# Altium project Main_Board.PrjPcb (part 2 of 44)

## Sheet Ultrascale+_01.SchDoc: Ultrascale+_01
size A3; Organization: Altium Limited; Address1: L3, 12a Rodborough Rd; Address2: Frenchs Forest; Address3: NSW; Address4: Australia 2086
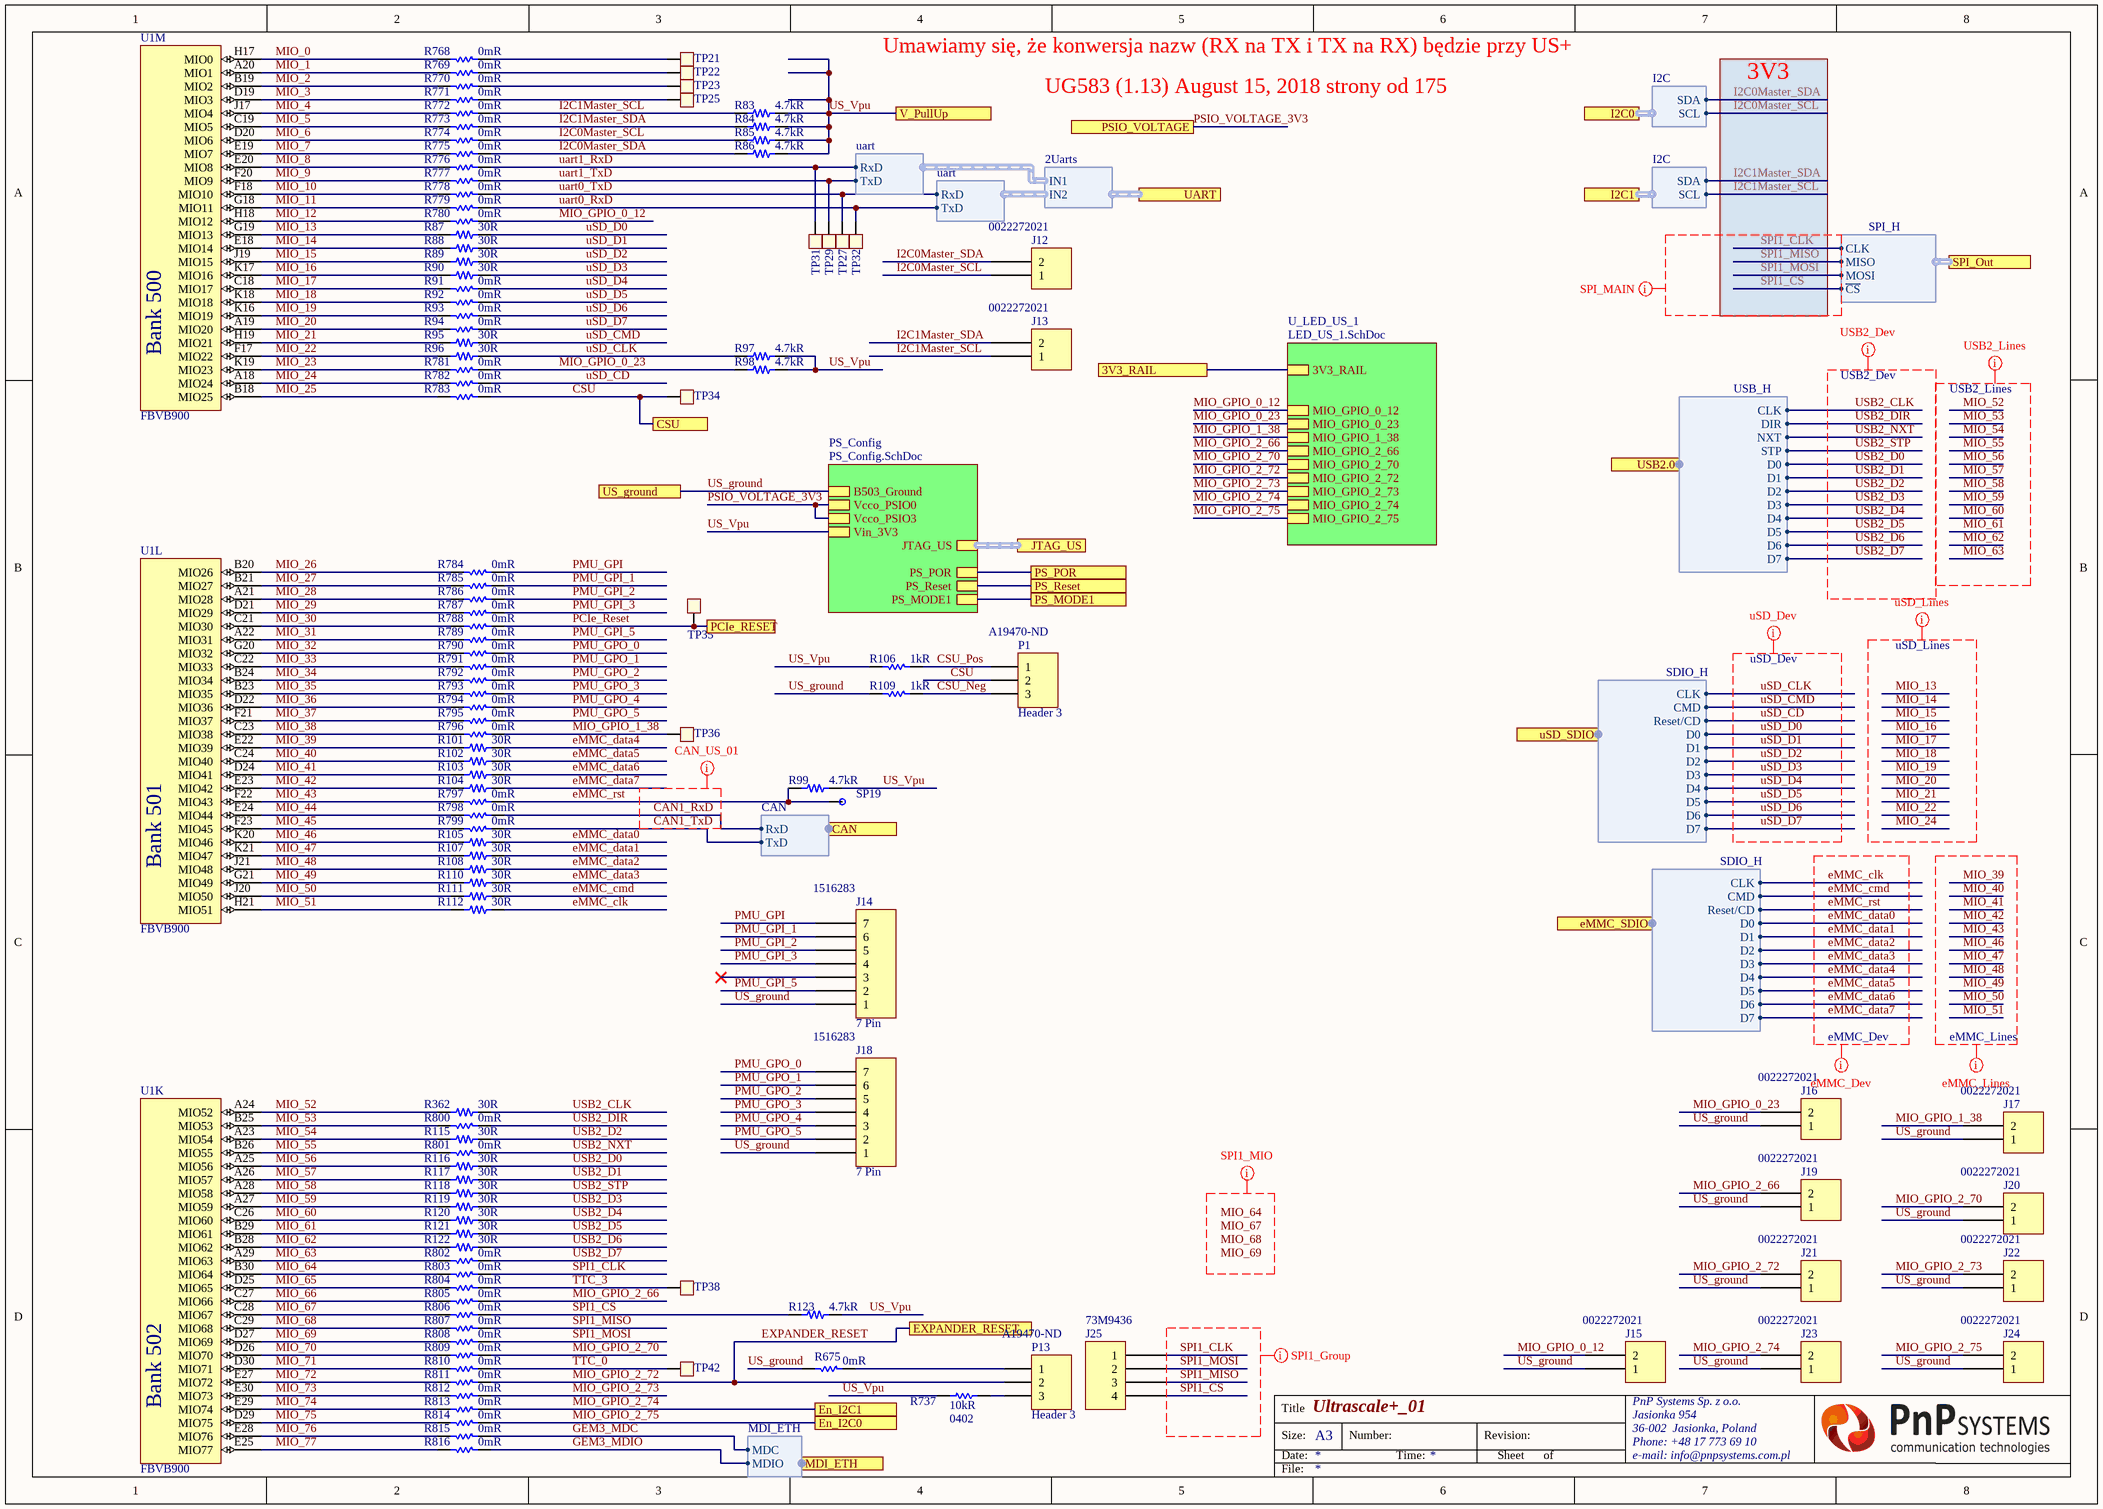
[diagram p1: Ultrascale+_01.SchDoc]

### Parts
J12  Supplier Part Number 1: 0022272021  [MOLEX KK 0022272021]  (hidden comment: MOLEX - 22-27-2021 - WIRE-BOARD CONNECTOR HEADER 2 POSITION, 2.54MM)
J13  Supplier Part Number 1: 0022272021  [MOLEX KK 0022272021]  (hidden comment: MOLEX - 22-27-2021 - WIRE-BOARD CONNECTOR HEADER 2 POSITION, 2.54MM)
J14  7 Pin  Supplier Part Number 1: 1516283  [JST XH B7B-XH-A]
J15  Supplier Part Number 1: 0022272021  [MOLEX KK 0022272021]  (hidden comment: MOLEX - 22-27-2021 - WIRE-BOARD CONNECTOR HEADER 2 POSITION, 2.54MM)
J16  Supplier Part Number 1: 0022272021  [MOLEX KK 0022272021]  (hidden comment: MOLEX - 22-27-2021 - WIRE-BOARD CONNECTOR HEADER 2 POSITION, 2.54MM)
J17  Supplier Part Number 1: 0022272021  [MOLEX KK 0022272021]  (hidden comment: MOLEX - 22-27-2021 - WIRE-BOARD CONNECTOR HEADER 2 POSITION, 2.54MM)
J18  7 Pin  Supplier Part Number 1: 1516283  [JST XH B7B-XH-A]
J19  Supplier Part Number 1: 0022272021  [MOLEX KK 0022272021]  (hidden comment: MOLEX - 22-27-2021 - WIRE-BOARD CONNECTOR HEADER 2 POSITION, 2.54MM)
J20  Supplier Part Number 1: 0022272021  [MOLEX KK 0022272021]  (hidden comment: MOLEX - 22-27-2021 - WIRE-BOARD CONNECTOR HEADER 2 POSITION, 2.54MM)
J21  Supplier Part Number 1: 0022272021  [MOLEX KK 0022272021]  (hidden comment: MOLEX - 22-27-2021 - WIRE-BOARD CONNECTOR HEADER 2 POSITION, 2.54MM)
J22  Supplier Part Number 1: 0022272021  [MOLEX KK 0022272021]  (hidden comment: MOLEX - 22-27-2021 - WIRE-BOARD CONNECTOR HEADER 2 POSITION, 2.54MM)
J23  Supplier Part Number 1: 0022272021  [MOLEX KK 0022272021]  (hidden comment: MOLEX - 22-27-2021 - WIRE-BOARD CONNECTOR HEADER 2 POSITION, 2.54MM)
J24  Supplier Part Number 1: 0022272021  [MOLEX KK 0022272021]  (hidden comment: MOLEX - 22-27-2021 - WIRE-BOARD CONNECTOR HEADER 2 POSITION, 2.54MM)
J25  Supplier Part Number 1: 73M9436  [JST XH B4B-XH-A]  (hidden comment: JST (JAPAN SOLDERLESS TERMINALS) - B4B-XH-A (LF)(SN) - Wire-To-Board-Steckverbinder, vertikal, 2.5 mm, 4 Kontakt(e), Stiftleiste, Baureihe XH)
P1  Header 3  Supplier Part Number 1: A19470-ND  [HDR1X3]
P13  Header 3  Supplier Part Number 1: A19470-ND  [HDR1X3]
R83  4.7kR  [RES 0402/1005 RF KK]
R84  4.7kR  [RES 0402/1005 RF KK]
R85  4.7kR  [RES 0402/1005 RF KK]
R86  4.7kR  [RES 0402/1005 RF KK]
R87  30R  [RES 0402/1005 RF KK]
R88  30R  [RES 0402/1005 RF KK]
R89  30R  [RES 0402/1005 RF KK]
R90  30R  [RES 0402/1005 RF KK]
R91  0mR  [RES 0402/1005 RF KK]
R92  0mR  [RES 0402/1005 RF KK]
R93  0mR  [RES 0402/1005 RF KK]
R94  0mR  [RES 0402/1005 RF KK]
R95  30R  [RES 0402/1005 RF KK]
R96  30R  [RES 0402/1005 RF KK]
R97  4.7kR  [RES 0402/1005 RF KK]
R98  4.7kR  [RES 0402/1005 RF KK]
R99  4.7kR  [RES 0402/1005 RF KK]
R101  30R  [RES 0402/1005 RF KK]
R102  30R  [RES 0402/1005 RF KK]
R103  30R  [RES 0402/1005 RF KK]
R104  30R  [RES 0402/1005 RF KK]
R105  30R  [RES 0402/1005 RF KK]
R106  1kR  [RES 0402/1005 RF KK]
R107  30R  [RES 0402/1005 RF KK]
R108  30R  [RES 0402/1005 RF KK]
R109  1kR  [RES 0402/1005 RF KK]
R110  30R  [RES 0402/1005 RF KK]
R111  30R  [RES 0402/1005 RF KK]
R112  30R  [RES 0402/1005 RF KK]
R115  30R  [RES 0402/1005 RF KK]
R116  30R  [RES 0402/1005 RF KK]
R117  30R  [RES 0402/1005 RF KK]
R118  30R  [RES 0402/1005 RF KK]
R119  30R  [RES 0402/1005 RF KK]
R120  30R  [RES 0402/1005 RF KK]
R121  30R  [RES 0402/1005 RF KK]
R122  30R  [RES 0402/1005 RF KK]
R123  4.7kR  [RES 0402/1005 RF KK]
R362  30R  [RES 0402/1005 RF KK]
R675  0mR  [RES 0402/1005 RF KK]
R737  10kR  Case Code (Imperial): 0402  [RES 0402/1005 RF KK]
R768  0mR  [RES 0402/1005 RF KK]
R769  0mR  [RES 0402/1005 RF KK]
R770  0mR  [RES 0402/1005 RF KK]
R771  0mR  [RES 0402/1005 RF KK]
R772  0mR  [RES 0402/1005 RF KK]
R773  0mR  [RES 0402/1005 RF KK]
R774  0mR  [RES 0402/1005 RF KK]
R775  0mR  [RES 0402/1005 RF KK]
R776  0mR  [RES 0402/1005 RF KK]
R777  0mR  [RES 0402/1005 RF KK]
R778  0mR  [RES 0402/1005 RF KK]
R779  0mR  [RES 0402/1005 RF KK]
R780  0mR  [RES 0402/1005 RF KK]
R781  0mR  [RES 0402/1005 RF KK]
R782  0mR  [RES 0402/1005 RF KK]
R783  0mR  [RES 0402/1005 RF KK]
R784  0mR  [RES 0402/1005 RF KK]
R785  0mR  [RES 0402/1005 RF KK]
R786  0mR  [RES 0402/1005 RF KK]
R787  0mR  [RES 0402/1005 RF KK]
R788  0mR  [RES 0402/1005 RF KK]
R789  0mR  [RES 0402/1005 RF KK]
R790  0mR  [RES 0402/1005 RF KK]
R791  0mR  [RES 0402/1005 RF KK]
R792  0mR  [RES 0402/1005 RF KK]
R793  0mR  [RES 0402/1005 RF KK]
R794  0mR  [RES 0402/1005 RF KK]
R795  0mR  [RES 0402/1005 RF KK]
R796  0mR  [RES 0402/1005 RF KK]
R797  0mR  [RES 0402/1005 RF KK]
R798  0mR  [RES 0402/1005 RF KK]
R799  0mR  [RES 0402/1005 RF KK]
R800  0mR  [RES 0402/1005 RF KK]
R801  0mR  [RES 0402/1005 RF KK]
R802  0mR  [RES 0402/1005 RF KK]
R803  0mR  [RES 0402/1005 RF KK]
R804  0mR  [RES 0402/1005 RF KK]
R805  0mR  [RES 0402/1005 RF KK]
R806  0mR  [RES 0402/1005 RF KK]
R807  0mR  [RES 0402/1005 RF KK]
R808  0mR  [RES 0402/1005 RF KK]
R809  0mR  [RES 0402/1005 RF KK]
R810  0mR  [RES 0402/1005 RF KK]
R811  0mR  [RES 0402/1005 RF KK]
R812  0mR  [RES 0402/1005 RF KK]
R813  0mR  [RES 0402/1005 RF KK]
R814  0mR  [RES 0402/1005 RF KK]
R815  0mR  [RES 0402/1005 RF KK]
R816  0mR  [RES 0402/1005 RF KK]
SP19  SP  [MeasureTP]  (value not drawn)
TP21  TestPoint  [TestPoint]  (value not drawn)
TP22  TestPoint  [TestPoint]  (value not drawn)
TP23  TestPoint  [TestPoint]  (value not drawn)
TP25  TestPoint  [TestPoint]  (value not drawn)
TP27  TestPoint  [TestPoint]  (value not drawn)
TP29  TestPoint  [TestPoint]  (value not drawn)
TP31  TestPoint  [TestPoint]  (value not drawn)
TP32  TestPoint  [TestPoint]  (value not drawn)
TP34  TestPoint  [TestPoint]  (value not drawn)
TP35  TestPoint  [TestPoint]  (value not drawn)
TP36  TestPoint  [TestPoint]  (value not drawn)
TP38  TestPoint  [TestPoint]  (value not drawn)
TP42  TestPoint  [TestPoint]  (value not drawn)
U1  FBVB900  [FBVB900 XX]  (parts K,L,M of 23)

### Sub-sheets
PS_Config = PS_Config.SchDoc: JTAG_US (harness JTAG), B503_Ground, Vcco_PSIO0, Vcco_PSIO3, Vin_3V3, PS_POR, PS_Reset, PS_MODE1
U_LED_US_1 = LED_US_1.SchDoc: 3V3_RAIL, MIO_GPIO_0_12, MIO_GPIO_0_23, MIO_GPIO_1_38, MIO_GPIO_2_66, MIO_GPIO_2_70, MIO_GPIO_2_72, MIO_GPIO_2_73, MIO_GPIO_2_74, MIO_GPIO_2_75

### Ports
3V3_RAIL, CAN (harness CAN), CSU, eMMC_SDIO (harness SDIO_H), En_I2C0, En_I2C1, EXPANDER_RESET, I2C0 (harness I2C), I2C1 (harness I2C), JTAG_US (harness JTAG), MDI_ETH (harness MDI_ETH), PCIe_RESET, PS_MODE1, PS_POR, PS_Reset, PSIO_VOLTAGE, SPI_Out (harness SPI_H), UART (harness 2Uarts), US_ground, USB2.0 (harness USB_H), uSD_SDIO (harness SDIO_H), V_PullUp

### Harnesses
I2C: SDA, SCL
SPI_H: CLK, MISO, MOSI, ~{CS}
SDIO_H: CLK, CMD, Reset/CD, D0, D1, D2, D3, D4, D5, D6, D7
uart: RxD, TxD
USB_H: CLK, DIR, NXT, STP, D0, D1, D2, D3, D4, D5, D6, D7
CAN: RxD, TxD
MDI_ETH: MDC, MDIO
2Uarts: IN2, IN1

### Nets
US_ground: J14.1 J15.1 J16.1 J17.1 J18.1 J19.1 J20.1 J21.1 J22.1 J23.1 J24.1 R109.1 R675.1 ; port US_ground, sheet PS_Config/B503_Ground  [project net B503_Ground]
3V3_RAIL: port 3V3_RAIL, sheet U_LED_US_1/3V3_RAIL
CAN1_RxD: R798.1 ; port CAN.RxD
CAN1_TxD: R799.1 ; port CAN.TxD
CSU: P1.2 R783.1 TP34.1 ; port CSU
CSU_Neg: P1.3 R109.2
CSU_Pos: P1.1 R106.2
eMMC_clk: R112.2 ; port eMMC_SDIO.CLK
eMMC_cmd: R111.2 ; port eMMC_SDIO.CMD
eMMC_data0: R105.2 ; port eMMC_SDIO.D0
eMMC_data1: R107.2 ; port eMMC_SDIO.D1
eMMC_data2: R108.2 ; port eMMC_SDIO.D2
eMMC_data3: R110.2 ; port eMMC_SDIO.D3
eMMC_data4: R101.2 ; port eMMC_SDIO.D4
eMMC_data5: R102.2 ; port eMMC_SDIO.D5
eMMC_data6: R103.2 ; port eMMC_SDIO.D6
eMMC_data7: R104.2 ; port eMMC_SDIO.D7
eMMC_rst: R99.1 R797.1 SP19.1 ; port eMMC_SDIO.Reset/CD
EXPANDER_RESET: J21.2 P13.2 R811.1 ; port EXPANDER_RESET, sheet U_LED_US_1/MIO_GPIO_2_72  [also labelled MIO_GPIO_2_72]
GEM3_MDC: R815.1 ; port MDI_ETH.MDC
GEM3_MDIO: R816.1 ; port MDI_ETH.MDIO
I2C0Master_SCL: J12.1 R85.1 R774.1 ; port I2C0.SCL  [project net I2C0_PS.SCL]
I2C0Master_SDA: J12.2 R86.1 R775.1 ; port I2C0.SDA  [project net I2C0_PS.SDA]
I2C1Master_SCL: J13.1 R83.1 R772.1 ; port I2C1.SCL  [project net I2C1_PS.SCL]
I2C1Master_SDA: J13.2 R84.1 R773.1 ; port I2C1.SDA  [project net I2C1_PS.SDA]
MIO_0: R768.2 U1.H17(MIO0)
MIO_1: R769.2 U1.A20(MIO1)
MIO_2: R770.2 U1.B19(MIO2)
MIO_3: R771.2 U1.D19(MIO3)
MIO_4: R772.2 U1.J17(MIO4)
MIO_5: R773.2 U1.C19(MIO5)
MIO_6: R774.2 U1.D20(MIO6)
MIO_7: R775.2 U1.E19(MIO7)
MIO_8: R776.2 U1.E20(MIO8)
MIO_9: R777.2 U1.F20(MIO9)
MIO_10: R778.2 U1.F18(MIO10)
MIO_11: R779.2 U1.G18(MIO11)
MIO_12: R780.2 U1.H18(MIO12)
MIO_13: R87.1 U1.G19(MIO13)
MIO_14: R88.1 U1.E18(MIO14)
MIO_15: R89.1 U1.J19(MIO15)
MIO_16: R90.1 U1.K17(MIO16)
MIO_17: R91.2 U1.C18(MIO17)
MIO_18: R92.2 U1.K18(MIO18)
MIO_19: R93.2 U1.K16(MIO19)
MIO_20: R94.2 U1.A19(MIO20)
MIO_21: R95.1 U1.H19(MIO21)
MIO_22: R96.1 U1.F17(MIO22)
MIO_23: R781.2 U1.K19(MIO23)
MIO_24: R782.2 U1.A18(MIO24)
MIO_25: R783.2 U1.B18(MIO25)
MIO_26: R784.2 U1.B20(MIO26)
MIO_27: R785.2 U1.B21(MIO27)
MIO_28: R786.2 U1.A21(MIO28)
MIO_29: R787.2 U1.D21(MIO29)
MIO_30: R788.2 U1.C21(MIO30)
MIO_31: R789.2 U1.A22(MIO31)
MIO_32: R790.2 U1.G20(MIO32)
MIO_33: R791.2 U1.C22(MIO33)
MIO_34: R792.2 U1.B24(MIO34)
MIO_35: R793.2 U1.B23(MIO35)
MIO_36: R794.2 U1.D22(MIO36)
MIO_37: R795.2 U1.F21(MIO37)
MIO_38: R796.2 U1.C23(MIO38)
MIO_39: R101.1 U1.E22(MIO39)
MIO_40: R102.1 U1.C24(MIO40)
MIO_41: R103.1 U1.D24(MIO41)
MIO_42: R104.1 U1.E23(MIO42)
MIO_43: R797.2 U1.F22(MIO43)
MIO_44: R798.2 U1.E24(MIO44)
MIO_45: R799.2 U1.F23(MIO45)
MIO_46: R105.1 U1.K20(MIO46)
MIO_47: R107.1 U1.K21(MIO47)
MIO_48: R108.1 U1.J21(MIO48)
MIO_49: R110.1 U1.G21(MIO49)
MIO_50: R111.1 U1.J20(MIO50)
MIO_51: R112.1 U1.H21(MIO51)
MIO_52: R362.1 U1.A24(MIO52)
MIO_53: R800.2 U1.B25(MIO53)
MIO_54: R115.1 U1.A23(MIO54)
MIO_55: R801.2 U1.B26(MIO55)
MIO_56: R116.1 U1.A25(MIO56)
MIO_57: R117.1 U1.A26(MIO57)
MIO_58: R118.1 U1.A28(MIO58)
MIO_59: R119.1 U1.A27(MIO59)
MIO_60: R120.1 U1.C26(MIO60)
MIO_61: R121.1 U1.B29(MIO61)
MIO_62: R122.1 U1.B28(MIO62)
MIO_63: R802.2 U1.A29(MIO63)
MIO_64: R803.2 U1.B30(MIO64)
MIO_65: R804.2 U1.D25(MIO65)
MIO_66: R805.2 U1.C27(MIO66)
MIO_67: R806.2 U1.C28(MIO67)
MIO_68: R807.2 U1.C29(MIO68)
MIO_69: R808.2 U1.D27(MIO69)
MIO_70: R809.2 U1.D26(MIO70)
MIO_71: R810.2 U1.D30(MIO71)
MIO_72: R811.2 U1.E27(MIO72)
MIO_73: R812.2 U1.E30(MIO73)
MIO_74: R813.2 U1.E29(MIO74)
MIO_75: R814.2 U1.D29(MIO75)
MIO_76: R815.2 U1.E28(MIO76)
MIO_77: R816.2 U1.E25(MIO77)
MIO_GPIO_0_12: J15.2 R780.1 ; sheet U_LED_US_1/MIO_GPIO_0_12
MIO_GPIO_0_23: J16.2 R98.1 R781.1 ; sheet U_LED_US_1/MIO_GPIO_0_23
MIO_GPIO_1_38: J17.2 R796.1 TP36.1 ; sheet U_LED_US_1/MIO_GPIO_1_38
MIO_GPIO_2_66: J19.2 R805.1 ; sheet U_LED_US_1/MIO_GPIO_2_66
MIO_GPIO_2_70: J20.2 R809.1 ; sheet U_LED_US_1/MIO_GPIO_2_70
MIO_GPIO_2_73: J22.2 R812.1 ; sheet U_LED_US_1/MIO_GPIO_2_73
MIO_GPIO_2_74: J23.2 R813.1 ; port En_I2C1, sheet U_LED_US_1/MIO_GPIO_2_74
MIO_GPIO_2_75: J24.2 R814.1 ; port En_I2C0, sheet U_LED_US_1/MIO_GPIO_2_75
PCIe_RESET: R788.1 TP35.1 ; port PCIe_RESET
PMU_GPI: J14.7 R784.1
PMU_GPI_1: J14.6 R785.1
PMU_GPI_2: J14.5 R786.1
PMU_GPI_3: J14.4 R787.1
PMU_GPI_5: J14.2 R789.1
PMU_GPO_0: J18.7 R790.1
PMU_GPO_1: J18.6 R791.1
PMU_GPO_2: J18.5 R792.1
PMU_GPO_3: J18.4 R793.1
PMU_GPO_4: J18.3 R794.1
PMU_GPO_5: J18.2 R795.1
PS_MODE1: port PS_MODE1, sheet PS_Config/PS_MODE1
PS_POR: port PS_POR, sheet PS_Config/PS_POR
PS_Reset: port PS_Reset, sheet PS_Config/PS_Reset
PSIO_VOLTAGE_3V3: R83.2 R84.2 R85.2 R86.2 R97.2 R98.2 R99.2 R106.1 R123.2 R737.2 ; port V_PullUp, port PSIO_VOLTAGE, sheet PS_Config/Vcco_PSIO0, sheet PS_Config/Vcco_PSIO3, sheet PS_Config/Vin_3V3  [also labelled US_Vpu]  [project net ETH_VDDIO]
SPI1_CLK: J25.1 R803.1 ; port SPI_Out.CLK
SPI1_CS: J25.4 R123.1 R806.1 ; port SPI_Out.~{CS}
SPI1_MISO: J25.3 R807.1 ; port SPI_Out.MISO
SPI1_MOSI: J25.2 R808.1 ; port SPI_Out.MOSI
TTC_0: R810.1 TP42.1
TTC_3: R804.1 TP38.1
uart0_RxD: R779.1 TP32.1 ; harness uart.TxD
uart0_TxD: R778.1 TP27.1 ; harness uart.RxD
uart1_RxD: R776.1 TP31.1 ; harness uart.RxD
uart1_TxD: R777.1 TP29.1 ; harness uart.TxD
USB2_CLK: R362.2 ; port USB2.0.CLK
USB2_D0: R116.2 ; port USB2.0.D0
USB2_D1: R117.2 ; port USB2.0.D1
USB2_D2: R115.2 ; port USB2.0.D2
USB2_D3: R119.2 ; port USB2.0.D3
USB2_D4: R120.2 ; port USB2.0.D4
USB2_D5: R121.2 ; port USB2.0.D5
USB2_D6: R122.2 ; port USB2.0.D6
USB2_D7: R802.1 ; port USB2.0.D7
USB2_DIR: R800.1 ; port USB2.0.DIR
USB2_NXT: R801.1 ; port USB2.0.NXT
USB2_STP: R118.2 ; port USB2.0.STP
uSD_CD: R782.1 ; port uSD_SDIO.Reset/CD
uSD_CLK: R96.2 R97.1 ; port uSD_SDIO.CLK
uSD_CMD: R95.2 ; port uSD_SDIO.CMD
uSD_D0: R87.2 ; port uSD_SDIO.D0
uSD_D1: R88.2 ; port uSD_SDIO.D1
uSD_D2: R89.2 ; port uSD_SDIO.D2
uSD_D3: R90.2 ; port uSD_SDIO.D3
uSD_D4: R91.1 ; port uSD_SDIO.D4
uSD_D5: R92.1 ; port uSD_SDIO.D5
uSD_D6: R93.1 ; port uSD_SDIO.D6
uSD_D7: R94.1 ; port uSD_SDIO.D7
NetP13_1: P13.1 R675.2
NetP13_3: P13.3 R737.1
NetR768_1: R768.1 TP21.1
NetR769_1: R769.1 TP22.1
NetR770_1: R770.1 TP23.1
NetR771_1: R771.1 TP25.1

Not connected (* = marked no-connect by the designer): J14 3*

### Buses and harness runs
harness port JTAG_US = sheet PS_Config/JTAG_US

### Layout directives
net class uSD_Lines: MIO_13, MIO_14, MIO_15, MIO_16, MIO_17, MIO_18, MIO_19, MIO_20, MIO_21, MIO_22, MIO_24
net class USB2_Lines: MIO_52, MIO_53, MIO_54, MIO_55, MIO_56, MIO_57, MIO_58, MIO_59, MIO_60, MIO_61, MIO_62, MIO_63
net class eMMC_Lines: MIO_39, MIO_40, MIO_41, MIO_42, MIO_43, MIO_46, MIO_47, MIO_48, MIO_49, MIO_50, MIO_51
net class SPI1_Group: SPI1_CLK, SPI1_CS, SPI1_MISO, SPI1_MOSI
net class USB2_Dev: USB2_CLK, USB2_D0, USB2_D1, USB2_D2, USB2_D3, USB2_D4, USB2_D5, USB2_D6, USB2_D7, USB2_DIR, USB2_NXT, USB2_STP
net class uSD_Dev: uSD_CD, uSD_CLK, uSD_CMD, uSD_D0, uSD_D1, uSD_D2, uSD_D3, uSD_D4, uSD_D5, uSD_D6, uSD_D7
net class eMMC_Dev: eMMC_clk, eMMC_cmd, eMMC_data0, eMMC_data1, eMMC_data2, eMMC_data3, eMMC_data4, eMMC_data5, eMMC_data6, eMMC_data7, eMMC_rst
net class CAN_US_01: CAN1_RxD, CAN1_TxD
net class SPI_MAIN: SPI1_CLK, SPI1_CS, SPI1_MISO, SPI1_MOSI
net class SPI1_MIO: MIO_64, MIO_67, MIO_68, MIO_69

### Notes on the sheet
- Umawiamy się, że konwersja nazw (RX na TX i TX na RX) będzie przy US+
- UG583 (1.13) August 15, 2018 strony od 175
- 3V3
- Labels drawn without touching a wire or pin: MIO_64, MIO_67, MIO_68, MIO_69
- Title
- Size:
- Date:
- A3
- Number:
- Time:
- Revision:
- Sheet
- of
- File:
- (in symbol FBVB900, part K) Bank 502
- (in symbol FBVB900, part L) Bank 501
- (in symbol FBVB900, part M) Bank 500

### Library data of the parts
J12 J13 J15-J17 J19-J24 = 2 Pin: Number of Positions: 2; Contact Resistance: 20mR; Current Rating: 4A; Voltage Rating: 250V; Gender: Male; Insulation Resistance: 50GR; Approvals: UL,CSA; Supplier 1: Avnet; Manufacturer: Molex; Manufacturer Part Number: 22-27-2021; RoHS: Yes; Category: Headers and Wire Housings; Stock 1: 3474; Pricing 1: 1=0,12370, 10=0,11289, 30=0,10755, 50=0,10087, 100=0,09486 (USD); Mount: Through Hole; Housing Color: Natural; Color: White; Housing Material: Nylon; Contact Plating: Tin,Copper; Contact Material: Brass,Tin; Material: Nylon; Min Operating Temperature: 0°C; Max Operating Temperature: 75°C; Orientation: Straight; Termination: Solder; Number of Rows: 1; Packaging: Bulk; Number of Contacts: 2; Number of Circuits: 2; Package Quantity: 24000; Contact Gender: Male; Voltage Rating (DC): 250V; Working Voltage: 250V; Voltage Rating (AC): 250V; Max Current Rating: 4A; Length: 10.16mm; Height: 11.7mm; Pitch: 2.54mm; Depth: 5.8mm; Lead Pitch: 2.54mm; Radiation Hardening: No; Lead Free: Lead Free; Flammability Rating: UL94 V-0; REACH SVHC: Unknown; ComponentLink1URL: https://datasheet.ciiva.com/9468/0022272021-pcb-headers-9468403.pdf?src-supplier=Avnet; ComponentLink1Description: https://datasheet.ciiva.com/9468/0022272021-pcb-headers-9468403.pdf?src-supplier=Avnet; ComponentLink2URL: https://datasheet.ciiva.com/30177/113940022272021-pcb-headers-30177601.pdf?src-supplier=Onlinecomponents.com; ComponentLink2Description: https://datasheet.ciiva.com/30177/113940022272021-pcb-headers-30177601.pdf?src-supplier=Onlinecomponents.com; ComponentLink3URL: https://datasheet.ciiva.com/15217/getdatasheetpartid-163454-15217683.pdf?src-supplier=Verical; ComponentLink3Description: https://datasheet.ciiva.com/15217/getdatasheetpartid-163454-15217683.pdf?src-supplier=Verical; ComponentLink4URL: https://datasheet.ciiva.com/5154/0022272021-pcb-headers-227458-5154933.pdf?src-supplier=Mouser; ComponentLink4Description: https://datasheet.ciiva.com/5154/0022272021-pcb-headers-227458-5154933.pdf?src-supplier=Mouser; ComponentLink5URL: https://datasheet.ciiva.com/11746/0900766b804624e4-11746551.pdf?src-supplier=RSComponents; ComponentLink5Description: https://datasheet.ciiva.com/11746/0900766b804624e4-11746551.pdf?src-supplier=RSComponents; ComponentLink6URL: https://datasheet.ciiva.com/19462/879254-19462349.pdf?src-supplier=Jameco; ComponentLink6Description: https://datasheet.ciiva.com/19462/879254-19462349.pdf?src-supplier=Jameco; ComponentLink7URL: https://datasheet.ciiva.com/25908/0022272021-pcb-headers-25908245.pdf?src-supplier=Avnet+Europe; ComponentLink7Description: https://datasheet.ciiva.com/25908/0022272021-pcb-headers-25908245.pdf?src-supplier=Avnet+Europe; ComponentLink8URL: https://datasheet.ciiva.com/20207/22-0838e-20207111.pdf?src-supplier=Rapid+Electronics; ComponentLink8Description: https://datasheet.ciiva.com/20207/22-0838e-20207111.pdf?src-supplier=Rapid+Electronics
J14 J18 = 7 Pin: JST (JAPAN SOLDERLESS TERMINALS) - B7B-XH-A (LF)(SN) - HEADER, VERTICAL, 7WAY; Connector Type: Header,Male Pin; Number of Positions: 7; Contact Resistance: 20mR; Current Rating: 3A; Voltage Rating (AC): 250V; Insulation Resistance: 1GR; Pitch: 2.5mm; Wire/Cable Gauge: 22AWG; Supplier 1: Farnell; Manufacturer: JST; Manufacturer Part Number: B7B-XH-A(LF)(SN); RoHS: Yes; Category: Headers and Wire Housings; Stock 1: 20576; Mount: Through Hole; Color: Natural; Housing Material: Polyamide; Contact Plating: Tin,Copper,Lead; Contact Material: Brass; Housing Color: White; Insulation Color: Natural; Contact Shape: Square; Insulation Material: Nylon; Min Operating Temperature: -25°C; Max Operating Temperature: 85°C; Packaging: Bulk; Termination: Solder; Number of Rows: 1; Max Current Rating: 3A; Number of Contacts: 7; Max Voltage Rating (AC): 250V; Orientation: Straight; Voltage Rating: 250V; Fastening Type: Detent; Length: 19.9mm; Depth: 5.75mm; Lead Pitch: 2.5mm; Lead Free: Lead Free; REACH SVHC: No SVHC; Flammability Rating: UL94 V-0; ComponentLink1URL: https://datasheet.ciiva.com/11747/0900766b80826551-11747681.pdf?src-supplier=RSComponents; ComponentLink1Description: https://datasheet.ciiva.com/11747/0900766b80826551-11747681.pdf?src-supplier=RSComponents; ComponentLink2URL: https://datasheet.ciiva.com/26894/getdatasheetpartid-440406-26894811.pdf?src-supplier=Verical; ComponentLink2Description: https://datasheet.ciiva.com/26894/getdatasheetpartid-440406-26894811.pdf?src-supplier=Verical
J25 = 4 Pin: Gender: Male; Contact Resistance: 20mR; Current Rating: 3A; Voltage Rating (AC): 250V; Connector Type: Male Pin; Number of Positions: 4; Insulation Resistance: 1GR; Wire/Cable Gauge: 22AWG; Pitch: 2.5mm; Supplier 1: Newark; Manufacturer: JST; Manufacturer Part Number: B4B-XH-A(LF)(SN); RoHS: Yes; Category: FFC / FPC; Mount: Through Hole; Material: Polyamide; Contact Plating: Tin,Copper,Lead; Contact Material: Brass; Color: Natural; Housing Material: Polyamide; Housing Color: White; Min Operating Temperature: -25°C; Max Operating Temperature: 85°C; Number of Rows: 1; Max Current Rating: 3A; Package Quantity: 500; Packaging: Bulk; Voltage Rating: 250V; Termination: Press-Fit; Max Voltage Rating (AC): 250V; Max Voltage Rating (DC): 250V; Number of Contacts: 4; Orientation: Straight; Length: 12.4mm; Lead Pitch: 2.5mm; Depth: 5.75mm; REACH SVHC: No SVHC; Lead Free: Lead Free; ComponentLink1URL: https://datasheet.ciiva.com/26894/getdatasheetpartid-455616-26894787.pdf?src-supplier=Verical; ComponentLink1Description: https://datasheet.ciiva.com/26894/getdatasheetpartid-455616-26894787.pdf?src-supplier=Verical; ComponentLink2URL: https://datasheet.ciiva.com/26924/getdatasheetpartid-640571-26924035.pdf?src-supplier=Verical; ComponentLink2Description: https://datasheet.ciiva.com/26924/getdatasheetpartid-640571-26924035.pdf?src-supplier=Verical; ComponentLink3URL: https://datasheet.ciiva.com/16203/b4b-xh-alfsn-16203642.pdf?src-supplier=Future+Electronics; ComponentLink3Description: https://datasheet.ciiva.com/16203/b4b-xh-alfsn-16203642.pdf?src-supplier=Future+Electronics; ComponentLink4URL: https://datasheet.ciiva.com/726/exh-726404.pdf?src-supplier=Digi-Key; ComponentLink4Description: https://datasheet.ciiva.com/726/exh-726404.pdf?src-supplier=Digi-Key
P1 P13 = Header 3: CONN HEADER VERT 3POS 2.54MM; Manufacturer: TE Connectivity; Manufacturer Part Number: 640456-3; Contact Current Rating: 5A; Number of Positions: 3; Voltage Rating (AC): 250V; Contact Resistance: 6mR; Connector Type: Connector,Pin,Plug,Header; Shrouded: No (Without); Connector System: Wire-to-Board; Plating Thickness: 3.81um; PCB Mount Retention: Without; Contact Style: Straight; Mating Connector Lock: Yes (With); Gender: Male; Circuit Application: Signal; PCB Mounting Orientation: Vertical; Contact Post Length: 3.56mm; PCB Thickness: 0.063inch; Tail Length: 0.14inch; Approvals: CSA; LatestRevisionDate: 17-Jul-2002; LatestRevisionNote: Re-released for DXP Platform.; Publisher: Altium Limited; Supplier 1: Digi-Key; RoHS: Yes; Category: Headers and Wire Housings; Stock 1: 108085; Pricing 1: 1=0,14000, 10=0,12900, 100=0,08910, 500=0,07544, 1000=0,06172, 5000=0,05486, 10000=0,05143 (USD); Mount: Through Hole; Housing Color: Natural; Contact Plating: Tin; Contact Material: Copper Alloy; Color: Beige,White; Housing Material: Polyester; Insulation Material: Thermoplastic; Insulation Color: Natural; Contact Shape: Square; Min Operating Temperature: -67°C; Max Operating Temperature: 221°C; Orientation: Straight; Termination: Solder; Number of Contacts: 3; Number of Rows: 1; Packaging: Bulk; Package Quantity: 5000; Fastening Type: Friction; Max Voltage Rating (AC): 250V; Contact Gender: Male; Backwall/Post Interruptions: No (Without); Contact Retention: No (Without); Mating Alignment: No (Without); Mating Retention: No (Without); PCB Mount Alignment: No (Without); Sealable: No (Without); Strain Relief: No (Without); Mounting Ears: No (Without); Current Rating: 5A; Voltage Rating: 250V; Panel Mount Retention: No (Without); Length: 0.4inch; Height: 7.87mm; Pitch: 2.54mm; Depth: 5.72mm; Contact Mating Length: 7.49mm; Radiation Hardening: No; ELV: Compliant; Lead Free: Lead Free; Flammability Rating: UL94 V-0; REACH SVHC: Unknown; ComponentLink1URL: https://datasheet.ciiva.com/6005/1712135-6005440.pdf?src-supplier=Farnell; ComponentLink1Description: https://datasheet.ciiva.com/6005/1712135-6005440.pdf?src-supplier=Farnell; ComponentLink2URL: https://datasheet.ciiva.com/19474/613940-19474164.pdf?src-supplier=Jameco; ComponentLink2Description: https://datasheet.ciiva.com/19474/613940-19474164.pdf?src-supplier=Jameco; ComponentLink3URL: https://datasheet.ciiva.com/16456/eng-ds-82056-mta-0608-16456886.pdf?src-supplier=Future+Electronics; ComponentLink3Description: https://datasheet.ciiva.com/16456/eng-ds-82056-mta-0608-16456886.pdf?src-supplier=Future+Electronics; ComponentLink4URL: https://datasheet.ciiva.com/11746/0900766b80027008-11746172.pdf?src-supplier=RSComponents; ComponentLink4Description: https://datasheet.ciiva.com/11746/0900766b80027008-11746172.pdf?src-supplier=RSComponents; ComponentLink5URL: https://datasheet.ciiva.com/14156/04384301-14156821.pdf?src-supplier=Distrelec; ComponentLink5Description: https://datasheet.ciiva.com/14156/04384301-14156821.pdf?src-supplier=Distrelec; ComponentLink6URL: https://datasheet.ciiva.com/14637/70083643-14637750.pdf?src-supplier=Allied+Electronics; ComponentLink6Description: https://datasheet.ciiva.com/14637/70083643-14637750.pdf?src-supplier=Allied+Electronics; ComponentLink7URL: https://datasheet.ciiva.com/709/eng-cd-640456-w2-709688.pdf?src-supplier=Digi-Key; ComponentLink7Description: https://datasheet.ciiva.com/709/eng-cd-640456-w2-709688.pdf?src-supplier=Digi-Key; ComponentLink8URL: https://datasheet.ciiva.com/7128/eng-ds-82056-mta-0608-7128744.pdf?src-supplier=Newark; ComponentLink8Description: https://datasheet.ciiva.com/7128/eng-ds-82056-mta-0608-7128744.pdf?src-supplier=Newark; ComponentLink9URL: https://datasheet.ciiva.com/30127/8852eng-ds-82056-mta-0608-30127480.pdf?src-supplier=Onlinecomponents.com; ComponentLink9Description: https://datasheet.ciiva.com/30127/8852eng-ds-82056-mta-0608-30127480.pdf?src-supplier=Onlinecomponents.com; ComponentLink10URL: https://datasheet.ciiva.com/16656/eng-ds-82056-mta-0608-16656523.pdf?src-supplier=Avnet+Europe; ComponentLink10Description: https://datasheet.ciiva.com/16656/eng-ds-82056-mta-0608-16656523.pdf?src-supplier=Avnet+Europe
R83-R86 R97-R99 R123 = Resistor: Manufacturer: Panasonic; Manufacturer Part Number: ERJ-2RKF4701X; Tolerance: 1%; Temperature Coefficient: 100ppm/°C; Power Rating: 100mW; Voltage Rating: 50V; Supplier 1: Digi-Key; Supplier Part Number 1: P4.70KLCT-ND; Stock 1: 5361977; Pricing 1: 1 = 0,10000, 10 = 0,05500, 100 = 0,02250, 1000 = 0,01009, 2500 = 0,00876, 5000 = 0,00724 (USD); RoHS: Yes; Mount: Surface Mount; Case/Package: 0402; Number of Pins: 2; Case Code (Imperial): 0402; Case Code (Metric): 1005; Contact Plating: Tin; Min Operating Temperature: -55°C; Max Operating Temperature: 155°C; Resistance: 4.7kR; Packaging: Tape and Reel; Composition: Thick Film; Package Quantity: 1; Termination: SMD/SMT; Voltage Rating (DC): 50V; Number of Terminations: 2; Military Standard: Not; Max Power Dissipation: 100mW; Features: Automotive AEC-Q200; Length: 1mm; Height: 0.35mm; Width: 0.02inch; Depth: 0.5mm; Radiation Hardening: No; Lead Free: Lead Free; REACH SVHC: No SVHC; ComponentLink1URL: https://datasheet.ciiva.com/11821/0900766b80f80784-11821329.pdf?src-supplier=RSComponents; ComponentLink1Description: https://datasheet.ciiva.com/11821/0900766b80f80784-11821329.pdf?src-supplier=RSComponents; ComponentLink2URL: https://datasheet.ciiva.com/30053/aoa0000ce2-30053990.pdf?src-supplier=Onlinecomponents.com; ComponentLink2Description: https://datasheet.ciiva.com/30053/aoa0000ce2-30053990.pdf?src-supplier=Onlinecomponents.com; ComponentLink3URL: https://datasheet.ciiva.com/7830/aoa0000ce2-7830727.pdf?src-supplier=Element14; ComponentLink3Description: https://datasheet.ciiva.com/7830/aoa0000ce2-7830727.pdf?src-supplier=Element14; ComponentLink4URL: https://datasheet.ciiva.com/22781/1678782-22781576.pdf?src-supplier=Farnell; ComponentLink4Description: https://datasheet.ciiva.com/22781/1678782-22781576.pdf?src-supplier=Farnell; ComponentLink5URL: https://datasheet.ciiva.com/9195/aoa0000ce2-9195737.pdf?src-supplier=Avnet; ComponentLink5Description: https://datasheet.ciiva.com/9195/aoa0000ce2-9195737.pdf?src-supplier=Avnet; ComponentLink6URL: https://datasheet.ciiva.com/17213/aoa0000ce2-17213180.pdf?src-supplier=Avnet+Europe; ComponentLink6Description: https://datasheet.ciiva.com/17213/aoa0000ce2-17213180.pdf?src-supplier=Avnet+Europe; ComponentLink7URL: https://datasheet.ciiva.com/22667/1678782-22667886.pdf?src-supplier=Element14; ComponentLink7Description: https://datasheet.ciiva.com/22667/1678782-22667886.pdf?src-supplier=Element14; ComponentLink8URL: https://datasheet.ciiva.com/16763/70260748-16763151.pdf?src-supplier=Allied+Electronics; ComponentLink8Description: https://datasheet.ciiva.com/16763/70260748-16763151.pdf?src-supplier=Allied+Electronics; ComponentLink9URL: https://datasheet.ciiva.com/22723/1678782-22723903.pdf?src-supplier=Element14; ComponentLink9Description: https://datasheet.ciiva.com/22723/1678782-22723903.pdf?src-supplier=Element14; ComponentLink10URL: https://datasheet.ciiva.com/24025/aoa0000ce2-24025663.pdf?src-supplier=Mouser; ComponentLink10Description: https://datasheet.ciiva.com/24025/aoa0000ce2-24025663.pdf?src-supplier=Mouser
R87-R90 R95 R96 R101-R105 R107 R108 R110-R112 R115-R122 R362 = Resistor: RES SMD 30 OHM 0.5% 1/16W 0402; Manufacturer: Panasonic; Manufacturer Part Number: ERA-2AKD300X; Power Rating: 62.5mW; Temperature Coefficient: 100ppm/°C; Max Power Dissipation: 63mW; Supplier 1: Digi-Key; Supplier Part Number 1: P30DDCT-ND; RoHS: Yes; Category: Chip SMD Resistors; Stock 1: 32301; Pricing 1: 1=0,10000, 10=0,07500, 100=0,03070, 1000=0,01377, 2500=0,01196, 5000=0,00988 (USD); Mount: Surface Mount; Case/Package: 0402; Case Code (Metric): 1005; Case Code (Imperial): 0402; Contact Plating: Tin; Min Operating Temperature: -55°C; Max Operating Temperature: 155°C; Resistance: 30R; Tolerance: 0.5%; Packaging: Tape and Reel; Package Quantity: 10000; Composition: Thin Film; Number of Terminations: 2; Length: 0.039inch; Height: 0.016inch; Width: 0.02inch; Lead Free: Lead Free; ComponentLink1URL: https://media.digikey.com/pdf/Data%20Sheets/Panasonic%20Resistors%20Thermistors%20PDFs/ERA_Series_LE.pdf?src-supplier=Digi-Key; ComponentLink1Description: https://media.digikey.com/pdf/Data%20Sheets/Panasonic%20Resistors%20Thermistors%20PDFs/ERA_Series_LE.pdf?src-supplier=Digi-Key; ComponentLink2URL: http://www.mouser.com/ds/2/315/AOA0000CE26-32660.pdf?src-supplier=Mouser; ComponentLink2Description: http://www.mouser.com/ds/2/315/AOA0000CE26-32660.pdf?src-supplier=Mouser; ComponentLink3URL: http://industrial.panasonic.com/www-data/pdf/AOA0000/AOA0000CE26.pdf?src-supplier=Avnet; ComponentLink3Description: http://industrial.panasonic.com/www-data/pdf/AOA0000/AOA0000CE26.pdf?src-supplier=Avnet; ComponentLink4URL: https://industrial.panasonic.com/cdbs/www-data/pdf/RDM0000/AOA0000C307.pdf?src-supplier=Digi-Key; ComponentLink4Description: https://industrial.panasonic.com/cdbs/www-data/pdf/RDM0000/AOA0000C307.pdf?src-supplier=Digi-Key
R91-R94 R675 R768-R816 = Resistor: Manufacturer 1: Yageo; Manufacturer Part Number 1: RC0402JR-070RL; Power Rating: 62.5mW; Tolerance: 5%; Voltage Rating: 50V; Max Power Dissipation: 63mW; Temperature Coefficient: 200ppm/°C; Supplier 1: Digi-Key; Supplier Part Number 1: 311-0.0JRCT-ND; Stock 1: 69822252; Pricing 1: 1=0.10000, 10=0.01200, 25=0.00920, 50=0.00680, 100=0.00510, 250=0.00388, 500=0.00308, 1000=0.00227, 5000=0.00163 (USD); RoHS: Yes; Case/Package: 0402; Contact Plating: Tin,Matte; Case Code (Metric): 1005; Case Code (Imperial): 0402; Min Operating Temperature: -55°C; Max Operating Temperature: 155°C; Resistance: 0mR; Packaging: Tape and Reel; Composition: Thick Film; Package Quantity: 1; Number of Terminations: 2; Termination: SMD/SMT; Military Standard: Not; Features: Moisture Resistant; Length: 1mm; Height: 0.016inch; Width: 0.02inch; Depth: 0.5mm; Radiation Hardening: No; REACH SVHC: Unknown; Lead Free: Lead Free; ComponentLink1URL: https://datasheet.ciiva.com/2452/pyu-rc0402-51-rohs-l-6-2452608.pdf?src-supplier=Digi-Key; ComponentLink1Description: https://datasheet.ciiva.com/2452/pyu-rc0402-51-rohs-l-6-2452608.pdf?src-supplier=Digi-Key; ComponentLink2URL: https://datasheet.ciiva.com/11808/0900766b80c66297-11808195.pdf?src-supplier=RSComponents; ComponentLink2Description: https://datasheet.ciiva.com/11808/0900766b80c66297-11808195.pdf?src-supplier=RSComponents; ComponentLink3URL: https://datasheet.ciiva.com/2452/pyu-r-int-thick-7-2452609.pdf?src-supplier=Digi-Key; ComponentLink3Description: https://datasheet.ciiva.com/2452/pyu-r-int-thick-7-2452609.pdf?src-supplier=Digi-Key; ComponentLink4URL: https://datasheet.ciiva.com/22747/1018594-22747515.pdf?src-supplier=Element14; ComponentLink4Description: https://datasheet.ciiva.com/22747/1018594-22747515.pdf?src-supplier=Element14; ComponentLink5URL: https://datasheet.ciiva.com/7983/1018594-7983535.pdf?src-supplier=Element14; ComponentLink5Description: https://datasheet.ciiva.com/7983/1018594-7983535.pdf?src-supplier=Element14; ComponentLink6URL: https://datasheet.ciiva.com/2452/pyu-r-int-thick-7-2452610.pdf?src-supplier=Digi-Key; ComponentLink6Description: https://datasheet.ciiva.com/2452/pyu-r-int-thick-7-2452610.pdf?src-supplier=Digi-Key; ComponentLink7URL: https://datasheet.ciiva.com/8896/pyu-rc0402-51-rohs-l-6-8896201.pdf?src-supplier=Avnet; ComponentLink7Description: https://datasheet.ciiva.com/8896/pyu-rc0402-51-rohs-l-6-8896201.pdf?src-supplier=Avnet; ComponentLink8URL: https://datasheet.ciiva.com/28386/pyu-rc0402-51-rohs-l-6-28386633.pdf?src-supplier=Avnet+Europe; ComponentLink8Description: https://datasheet.ciiva.com/28386/pyu-rc0402-51-rohs-l-6-28386633.pdf?src-supplier=Avnet+Europe; ComponentLink9URL: https://datasheet.ciiva.com/15189/getdatasheetpartid-326379-15189533.pdf?src-supplier=Verical; ComponentLink9Description: https://datasheet.ciiva.com/15189/getdatasheetpartid-326379-15189533.pdf?src-supplier=Verical
R106 R109 = Resistor: PANASONIC - ERJ-2RKF1001X - SMD Chip Resistor, 0402 [1005 Metric], 1 kohm, ERJ2R Series, 50 V, Thick Film, 100 mW; Temperature Coefficient: 100ppm/°C; Tolerance: 1%; Voltage Rating (DC): 50V; Power Rating: 100mW; Supplier 1: Digi-Key; Supplier Part Number 1: P1.00KLDKR-ND; Manufacturer: Panasonic; Manufacturer Part Number: ERJ-2RKF1001X; RoHS: Yes; Category: Chip SMD Resistors; Stock 1: 1864188; Pricing 1: 1=0,10000, 10=0,04300, 100=0,01740, 1000=0,00782, 2500=0,00678, 5000=0,00561 (USD); Mount: Surface Mount; Case/Package: 0402; Number of Pins: 2; Contact Plating: Tin; Case Code (Imperial): 0402; Case Code (Metric): 1005; Min Operating Temperature: -55°C; Max Operating Temperature: 155°C; Composition: Thick Film; Resistance: 1kR; Termination: SMD/SMT; Number of Terminations: 2; Military Standard: Not; Features: Automotive AEC-Q200; Packaging: Tape and Reel; Voltage Rating: 50V; Package Quantity: 1; Max Power Dissipation: 100mW; Working Voltage: 50V; Length: 1mm; Height: 0.35mm; Depth: 0.5mm; Width: 0.5mm; Radiation Hardening: No; Lead Free: Lead Free; REACH SVHC: No SVHC; ComponentLink1URL: https://datasheet.ciiva.com/11821/0900766b80f80784-11821203.pdf?src-supplier=RSComponents; ComponentLink1Description: https://datasheet.ciiva.com/11821/0900766b80f80784-11821203.pdf?src-supplier=RSComponents; ComponentLink2URL: https://datasheet.ciiva.com/7942/aoa0000ce2-7942426.pdf?src-supplier=Element14; ComponentLink2Description: https://datasheet.ciiva.com/7942/aoa0000ce2-7942426.pdf?src-supplier=Element14; ComponentLink3URL: https://datasheet.ciiva.com/16523/aoa0000ce2-16523834.pdf?src-supplier=Avnet+Asia; ComponentLink3Description: https://datasheet.ciiva.com/16523/aoa0000ce2-16523834.pdf?src-supplier=Avnet+Asia; ComponentLink4URL: https://datasheet.ciiva.com/17215/aoa0000ce2-17215308.pdf?src-supplier=Avnet+Europe; ComponentLink4Description: https://datasheet.ciiva.com/17215/aoa0000ce2-17215308.pdf?src-supplier=Avnet+Europe; ComponentLink5URL: https://datasheet.ciiva.com/22673/1678782-22673916.pdf?src-supplier=Element14; ComponentLink5Description: https://datasheet.ciiva.com/22673/1678782-22673916.pdf?src-supplier=Element14; ComponentLink6URL: https://datasheet.ciiva.com/28532/1678782-28532109.pdf?src-supplier=Element14; ComponentLink6Description: https://datasheet.ciiva.com/28532/1678782-28532109.pdf?src-supplier=Element14; ComponentLink7URL: https://datasheet.ciiva.com/16767/70260748-16767559.pdf?src-supplier=Allied+Electronics; ComponentLink7Description: https://datasheet.ciiva.com/16767/70260748-16767559.pdf?src-supplier=Allied+Electronics; ComponentLink8URL: https://datasheet.ciiva.com/9198/aoa0000ce2-9198920.pdf?src-supplier=Avnet; ComponentLink8Description: https://datasheet.ciiva.com/9198/aoa0000ce2-9198920.pdf?src-supplier=Avnet; ComponentLink9URL: https://datasheet.ciiva.com/16771/70260748-16771979.pdf?src-supplier=Allied+Electronics; ComponentLink9Description: https://datasheet.ciiva.com/16771/70260748-16771979.pdf?src-supplier=Allied+Electronics
R737 = Resistor: Surface Mount Thick Film Resistor, Rc Series, 10 Kohm, 62.5 Mw, - 1%, 50 V, 0402 [1005 Metric]; Manufacturer: Yageo; Manufacturer Part Number: RC0402FR-0710KL; Voltage Rating: 50V; Power Rating: 62.5mW; Temperature Coefficient: 100ppm/°C; Supplier 1: Digi-Key; Supplier Part Number 1: 311-10.0KLRDKR-ND; RoHS: Yes; Category: Chip SMD Resistors; Stock 1: 50506721; Pricing 1: 1=0,10000, 10=0,01600, 100=0,00640, 1000=0,00289, 2500=0,00251, 5000=0,00207 (USD); Case/Package: 0402; Number of Pins: 2; Case Code (Metric): 1005; Min Operating Temperature: -55°C; Max Operating Temperature: 155°C; Resistance: 10kR; Tolerance: 1%; Packaging: Tape and Reel; Termination: SMD/SMT; Composition: Thick Film; Military Standard: Not; Voltage Rating (DC): 50V; Working Voltage: 50V; Number of Terminations: 2; Length: 1mm; Height: 0.32mm; Width: 0.5mm; Depth: 0.5mm; Lead Pitch: 0.2mm; REACH SVHC: No SVHC; Lead Free: Lead Free; ComponentLink1URL: https://datasheet.ciiva.com/7660/38568-7660787.pdf?src-supplier=Element14; ComponentLink1Description: https://datasheet.ciiva.com/7660/38568-7660787.pdf?src-supplier=Element14; ComponentLink2URL: https://datasheet.ciiva.com/7849/1784430-7849813.pdf?src-supplier=Element14; ComponentLink2Description: https://datasheet.ciiva.com/7849/1784430-7849813.pdf?src-supplier=Element14; ComponentLink3URL: https://datasheet.ciiva.com/7849/1686128-7849814.pdf?src-supplier=Element14; ComponentLink3Description: https://datasheet.ciiva.com/7849/1686128-7849814.pdf?src-supplier=Element14; ComponentLink4URL: https://datasheet.ciiva.com/7849/1784430-7849815.pdf?src-supplier=Element14; ComponentLink4Description: https://datasheet.ciiva.com/7849/1784430-7849815.pdf?src-supplier=Element14; ComponentLink5URL: https://datasheet.ciiva.com/22747/1018594-22747512.pdf?src-supplier=Element14; ComponentLink5Description: https://datasheet.ciiva.com/22747/1018594-22747512.pdf?src-supplier=Element14; ComponentLink6URL: https://datasheet.ciiva.com/12667/pyu-rc0402-51-rohs-l-6-r-12667067.pdf?src-supplier=Mouser; ComponentLink6Description: https://datasheet.ciiva.com/12667/pyu-rc0402-51-rohs-l-6-r-12667067.pdf?src-supplier=Mouser; ComponentLink7URL: https://datasheet.ciiva.com/7983/1018594-7983486.pdf?src-supplier=Element14; ComponentLink7Description: https://datasheet.ciiva.com/7983/1018594-7983486.pdf?src-supplier=Element14
TP21-TP23 TP25 TP27 TP29 TP31 TP32 TP34-TP36 TP38 TP42 = TestPoint: Manufacturer: Keystone Electronics; Manufacturer Part Number: 5001; Plating: Silver; Body Material: PBT,Bronze; Number of Ports: 1; Insulation: Insulated; Inside Diameter: 1.27mm; Outside Diameter: 2.54mm; Hole Diameter: 1.6mm; Supplier 1: Digi-Key; Stock 1: 352180; Pricing 1: 1 = 0,35000, 10 = 0,33500, 25 = 0,30800, 100 = 0,30150, 250 = 0,28304, 500 = 0,25230, 1000 = 0,17140, 2500 = 0,15296, 5000 = 0,14340 (USD); RoHS: Yes; Mount: Through Hole,PCB; Color: Black; Contact Material: Bronze; Contact Plating: Silver,Tin; Material: Nylon,Bronze,Silver; Housing Color: Black; Packaging: Bulk; Package Quantity: 100; Termination: Through Hole; Number of Contacts: 1; Orientation: Straight; Diameter: 2.54mm; Length: 7.62mm; Height: 0.3inch; Lead Free: Lead Free; REACH SVHC: No SVHC; Flammability Rating: UL94 V-0; ComponentLink1URL: https://datasheet.ciiva.com/27052/1581986-27052611.pdf?src-supplier=Jameco; ComponentLink1Description: https://datasheet.ciiva.com/27052/1581986-27052611.pdf?src-supplier=Jameco; ComponentLink2URL: https://datasheet.ciiva.com/11836/0900766b8009b7c7-11836045.pdf?src-supplier=RSComponents; ComponentLink2Description: https://datasheet.ciiva.com/11836/0900766b8009b7c7-11836045.pdf?src-supplier=RSComponents; ComponentLink3URL: https://datasheet.ciiva.com/22631/1703983-22631100.pdf?src-supplier=Element14; ComponentLink3Description: https://datasheet.ciiva.com/22631/1703983-22631100.pdf?src-supplier=Element14; ComponentLink4URL: https://datasheet.ciiva.com/16318/m60-2p60-16318423.pdf?src-supplier=Future+Electronics; ComponentLink4Description: https://datasheet.ciiva.com/16318/m60-2p60-16318423.pdf?src-supplier=Future+Electronics; Supplier Part Number 1: 36-5001-ND
U1 = FBVB900: FPGA Zynq UltraScale+ Family 192150 Cells 20nm Technology 0.85V 900-Pin FCBGA Tray; Manufacturer Part Number: XCZU4CG-1FBVB900E; Manufacturer: Xilinx; Peripherals: WDT,DMA; Interface: I2C,SPI,USB,Ethernet,MMC,SDIO,SD,UART,USART,EBI/EMI; Core Architecture: ARM; RAM Size: 256KB; Frequency: 500MHz; Number of I/Os: 204; Supplier 1: Mouser; Supplier Part Number 1: 217-CZU4CG-1FBVB900E; Stock 1: 3; Pricing 1: 1=0,00000, 5=1060,70000 (USD); RoHS: No; Case/Package: FCBGA; Min Operating Temperature: 0°C; Max Operating Temperature: 100°C; Packaging: Tray; ComponentLink1URL: https://www.xilinx.com/support/documentation/data_sheets/ds891-zynq-ultrascale-plus-overview.pdf?src-supplier=Digi-Key; ComponentLink1Description: https://www.xilinx.com/support/documentation/data_sheets/ds891-zynq-ultrascale-plus-overview.pdf?src-supplier=Digi-Key; ComponentLink2URL: https://www.xilinx.com/support/documentation/data_sheets/ds925-zynq-ultrascale-plus.pdf?src-supplier=Digi-Key; ComponentLink2Description: https://www.xilinx.com/support/documentation/data_sheets/ds925-zynq-ultrascale-plus.pdf?src-supplier=Digi-Key; Supplier 2: Avnet; Supplier 3: Digi-Key; Supplier Part Number 2: XCZU4CG-1FBVB900E; Supplier Part Number 3: XCZU4CG-1FBVB900E-ND